# Altium schematic sheet Power_Supply.SchDoc: Power Supply
size A3; SheetNumber: 4; SheetTotal: 7
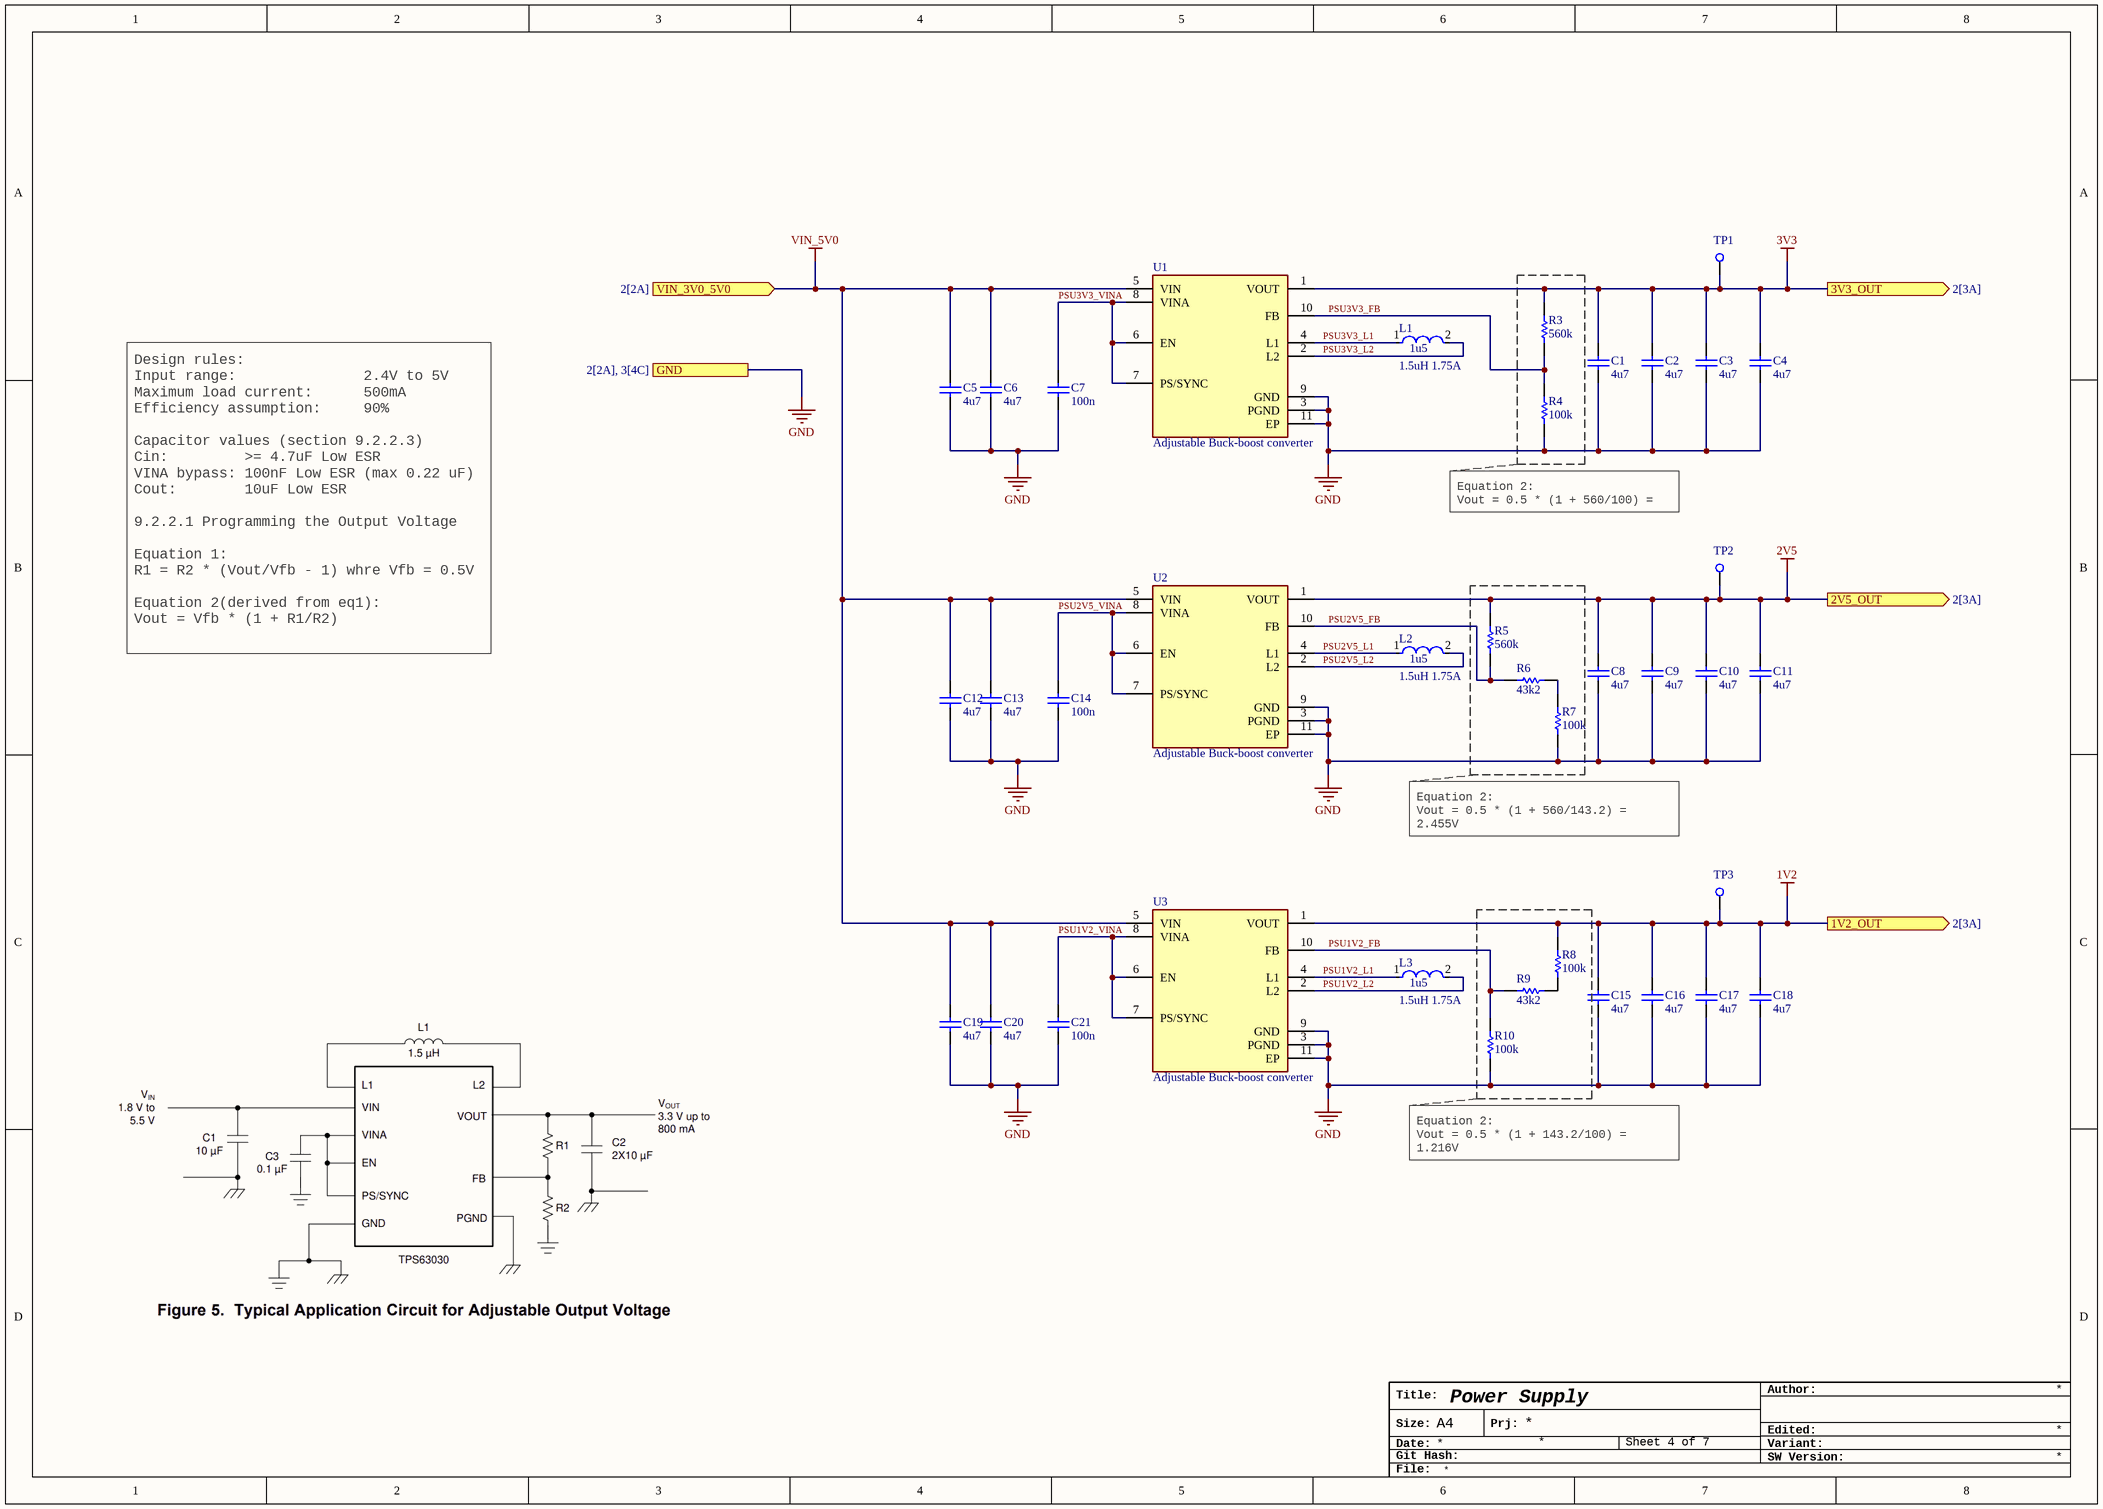
[diagram p0: Power_Supply.SchDoc]

## Parts
C1  value 4u7  [CAPC1607X09L - 0603]  (hidden comment: 4.7uF 35V)
C2  value 4u7  [CAPC1607X09L - 0603]  (hidden comment: 4.7uF 35V)
C3  value 4u7  [CAPC1607X09L - 0603]  (hidden comment: 4.7uF 35V)
C4  value 4u7  [CAPC1607X09L - 0603]  (hidden comment: 4.7uF 35V)
C5  value 4u7  [CAPC1607X09L - 0603]  (hidden comment: 4.7uF 35V)
C6  value 4u7  [CAPC1607X09L - 0603]  (hidden comment: 4.7uF 35V)
C7  value 100n  [CAPC1607X09L - 0603]  (hidden comment: 100nF 50V)
C8  value 4u7  [CAPC1607X09L - 0603]  (hidden comment: 4.7uF 35V)
C9  value 4u7  [CAPC1607X09L - 0603]  (hidden comment: 4.7uF 35V)
C10  value 4u7  [CAPC1607X09L - 0603]  (hidden comment: 4.7uF 35V)
C11  value 4u7  [CAPC1607X09L - 0603]  (hidden comment: 4.7uF 35V)
C12  value 4u7  [CAPC1607X09L - 0603]  (hidden comment: 4.7uF 35V)
C13  value 4u7  [CAPC1607X09L - 0603]  (hidden comment: 4.7uF 35V)
C14  value 100n  [CAPC1607X09L - 0603]  (hidden comment: 100nF 50V)
C15  value 4u7  [CAPC1607X09L - 0603]  (hidden comment: 4.7uF 35V)
C16  value 4u7  [CAPC1607X09L - 0603]  (hidden comment: 4.7uF 35V)
C17  value 4u7  [CAPC1607X09L - 0603]  (hidden comment: 4.7uF 35V)
C18  value 4u7  [CAPC1607X09L - 0603]  (hidden comment: 4.7uF 35V)
C19  value 4u7  [CAPC1607X09L - 0603]  (hidden comment: 4.7uF 35V)
C20  value 4u7  [CAPC1607X09L - 0603]  (hidden comment: 4.7uF 35V)
C21  value 100n  [CAPC1607X09L - 0603]  (hidden comment: 100nF 50V)
L1  1.5uH 1.75A  value 1u5  [LQH32PB_N0-MFG]
L2  1.5uH 1.75A  value 1u5  [LQH32PB_N0-MFG]
L3  1.5uH 1.75A  value 1u5  [LQH32PB_N0-MFG]
R3  560k  [RESC1508X05L - 0603]
R4  100k  [RESC1508X05L - 0603]
R5  560k  [RESC1508X05L - 0603]
R6  value 43k2  [RESC1508X05L - 0603]  (hidden comment: 43.2k)
R7  100k  [RESC1508X05L - 0603]
R8  100k  [RESC1508X05L - 0603]
R9  value 43k2  [RESC1508X05L - 0603]  (hidden comment: 43.2k)
R10  100k  [RESC1508X05L - 0603]
TP1  Test Point  [TP_CIRC_SMD_1mm]  (value not drawn)  (no BOM)
TP2  Test Point  [TP_CIRC_SMD_1mm]  (value not drawn)  (no BOM)
TP3  Test Point  [TP_CIRC_SMD_1mm]  (value not drawn)  (no BOM)
U1  Adjustable Buck-boost converter  [SON10_2.5x2.5_GEN]
U2  Adjustable Buck-boost converter  [SON10_2.5x2.5_GEN]
U3  Adjustable Buck-boost converter  [SON10_2.5x2.5_GEN]

## Ports
1V2_OUT (out, see 2[3A]), 2V5_OUT (out, see 2[3A]), 3V3_OUT (out, see 2[3A]), GND (see 2[2A], 3[4C]), VIN_3V0_5V0 (in, see 2[2A])

## Nets
1V2: C15.2 C16.2 C17.2 C18.2 R8.2 TP3.1 U3.1(VOUT) ; port 1V2_OUT
2V5: C8.2 C9.2 C10.2 C11.2 R5.2 TP2.1 U2.1(VOUT) ; port 2V5_OUT
3V3: C1.2 C2.2 C3.2 C4.2 R3.2 TP1.1 U1.1(VOUT) ; port 3V3_OUT
GND: C1.1 C2.1 C3.1 C4.1 C5.1 C6.1 C7.1 C8.1 C9.1 C10.1 C11.1 C12.1 C13.1 C14.1 C15.1 C16.1 C17.1 C18.1 C19.1 C20.1 C21.1 R4.1 R7.1 R10.1 U1.3(PGND) U1.9(GND) U1.11(EP) U2.3(PGND) U2.9(GND) U2.11(EP) U3.3(PGND) U3.9(GND) U3.11(EP) ; port GND
VIN_5V0: C5.2 C6.2 C12.2 C13.2 C19.2 C20.2 U1.5(VIN) U2.5(VIN) U3.5(VIN) ; port VIN_3V0_5V0
PSU1V2_FB: R9.2 R10.2 U3.10(FB)
PSU1V2_L1: L3.1 U3.4(L1)
PSU1V2_L2: L3.2 U3.2(L2)
PSU1V2_VINA: C21.2 U3.6(EN) U3.7(PS/SYNC) U3.8(VINA)
PSU2V5_FB: R5.1 R6.1 U2.10(FB)
PSU2V5_L1: L2.1 U2.4(L1)
PSU2V5_L2: L2.2 U2.2(L2)
PSU2V5_VINA: C14.2 U2.6(EN) U2.7(PS/SYNC) U2.8(VINA)
PSU3V3_FB: R3.1 R4.2 U1.10(FB)
PSU3V3_L1: L1.1 U1.4(L1)
PSU3V3_L2: L1.2 U1.2(L2)
PSU3V3_VINA: C7.2 U1.6(EN) U1.7(PS/SYNC) U1.8(VINA)
NetR6_2: R6.2 R7.2
NetR8_1: R8.1 R9.1

## Notes on the sheet
- Equation 2:
  Vout = 0.5 * (1 + 560/100) = 3.3V
- Design rules:
  Input range:               2.4V to 5V
  Maximum load current:      500mA
  Efficiency assumption:     90%
  Capacitor values (section 9.2.2.3)
  Cin:         >= 4.7uF Low ESR
  VINA bypass: 100nF Low ESR (max 0.22 uF)
  Cout:        10uF Low ESR
  9.2.2.1 Programming the Output Voltage
  Equation 1:
  R1 = R2 * (Vout/Vfb - 1) whre Vfb = 0.5V
  Equation 2(derived from eq1):
  Vout = Vfb * (1 + R1/R2)
- Equation 2:
  Vout = 0.5 * (1 + 560/143.2) = 2.455V
  1.8% off
- (near R10) Equation 2:
  Vout = 0.5 * (1 + 143.2/100) = 1.216V
  1.33% off
- Title:
- Author:
- Size:
- Date:
- Git Hash:
- A4
- Prj:
- SW Version:
- Variant:
- Edited:
- File:

## Library data of the parts
C1-C6 C8-C13 C15-C20 = CAP-0603-4.7uF-35V-X5R: Ceramic capacitor 4.7uF 35V X5R 0603; Supplier 1: DigiKey; Supplier Part Number 1: 490-7205-1-ND
C7 C14 C21 = CAP-0603-100nF-50V-X7R: Ceramic capacitor 100nF 50V X7R 0603; Supplier 1: DigiKey; Supplier Part Number 1: 490-5798-1-ND
L1-L3 = IND-1210-1.5uH-1.75A: 1.5 µH Shielded Drum Core, Wirewound Inductor 1.75 A 68.4mOhm Max; Supplier 1: DigiKey; Supplier Part Number 1: 490-5335-6-ND
R3 R5 = RES-0603-560k-1%: 560k ±1% 0603 100mW 75V; Part Number: 0402WGF1001TCE; Manufacturer: UNI-ROYAL; Supplier 1: DigiKey; Supplier Part Number 1: 311-100KHRCT-ND; Value: 560k
R4 R7 R8 R10 = RES-0603-100k-1%: 100k ±1% 0603 100mW 75V; Part Number: 0402WGF1001TCE; Manufacturer: UNI-ROYAL; Supplier 1: DigiKey; Supplier Part Number 1: 311-100KHRCT-ND; Value: 100k
R6 R9 = RES-0603-43.2k-1%: 43.2k ±1% 0603 100mW 75V; Part Number: 0402WGF1001TCE; Manufacturer: UNI-ROYAL; Supplier 1: DigiKey; Supplier Part Number 1: 311-43.2KHRCT-ND
TP1-TP3 = Test_Point_Pad: Test Point Pad
U1-U3 = IC-MPN-TPS63030: IC buck-boost regulator 900mA TPS63030 SON-10 TPS63031; Datasheet Link: http://www.ti.com/lit/gpn/tps63031